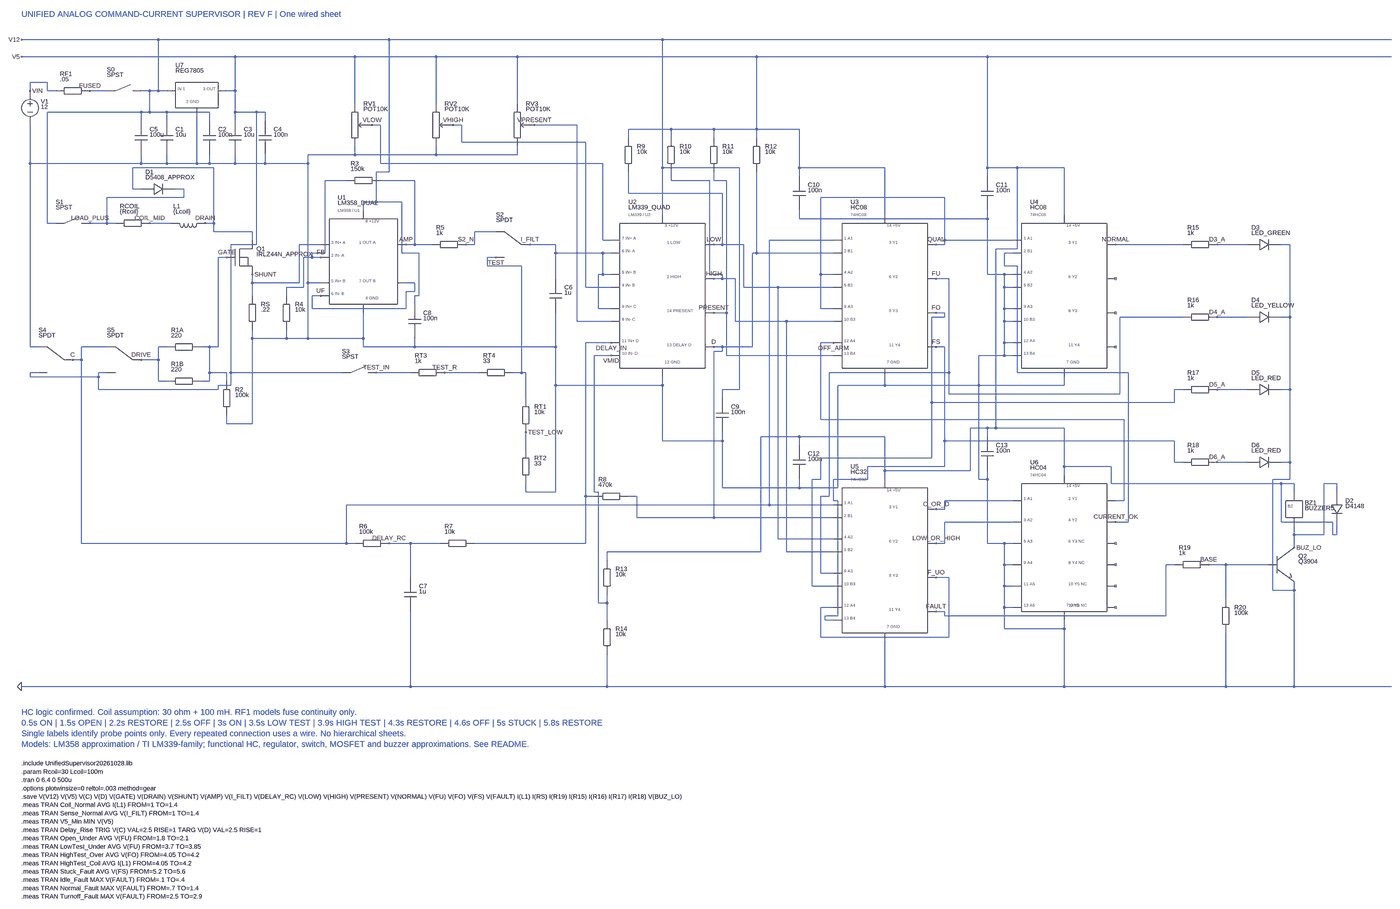
[diagram p0: schematic Unified_Supervisor.asc, whole sheet]
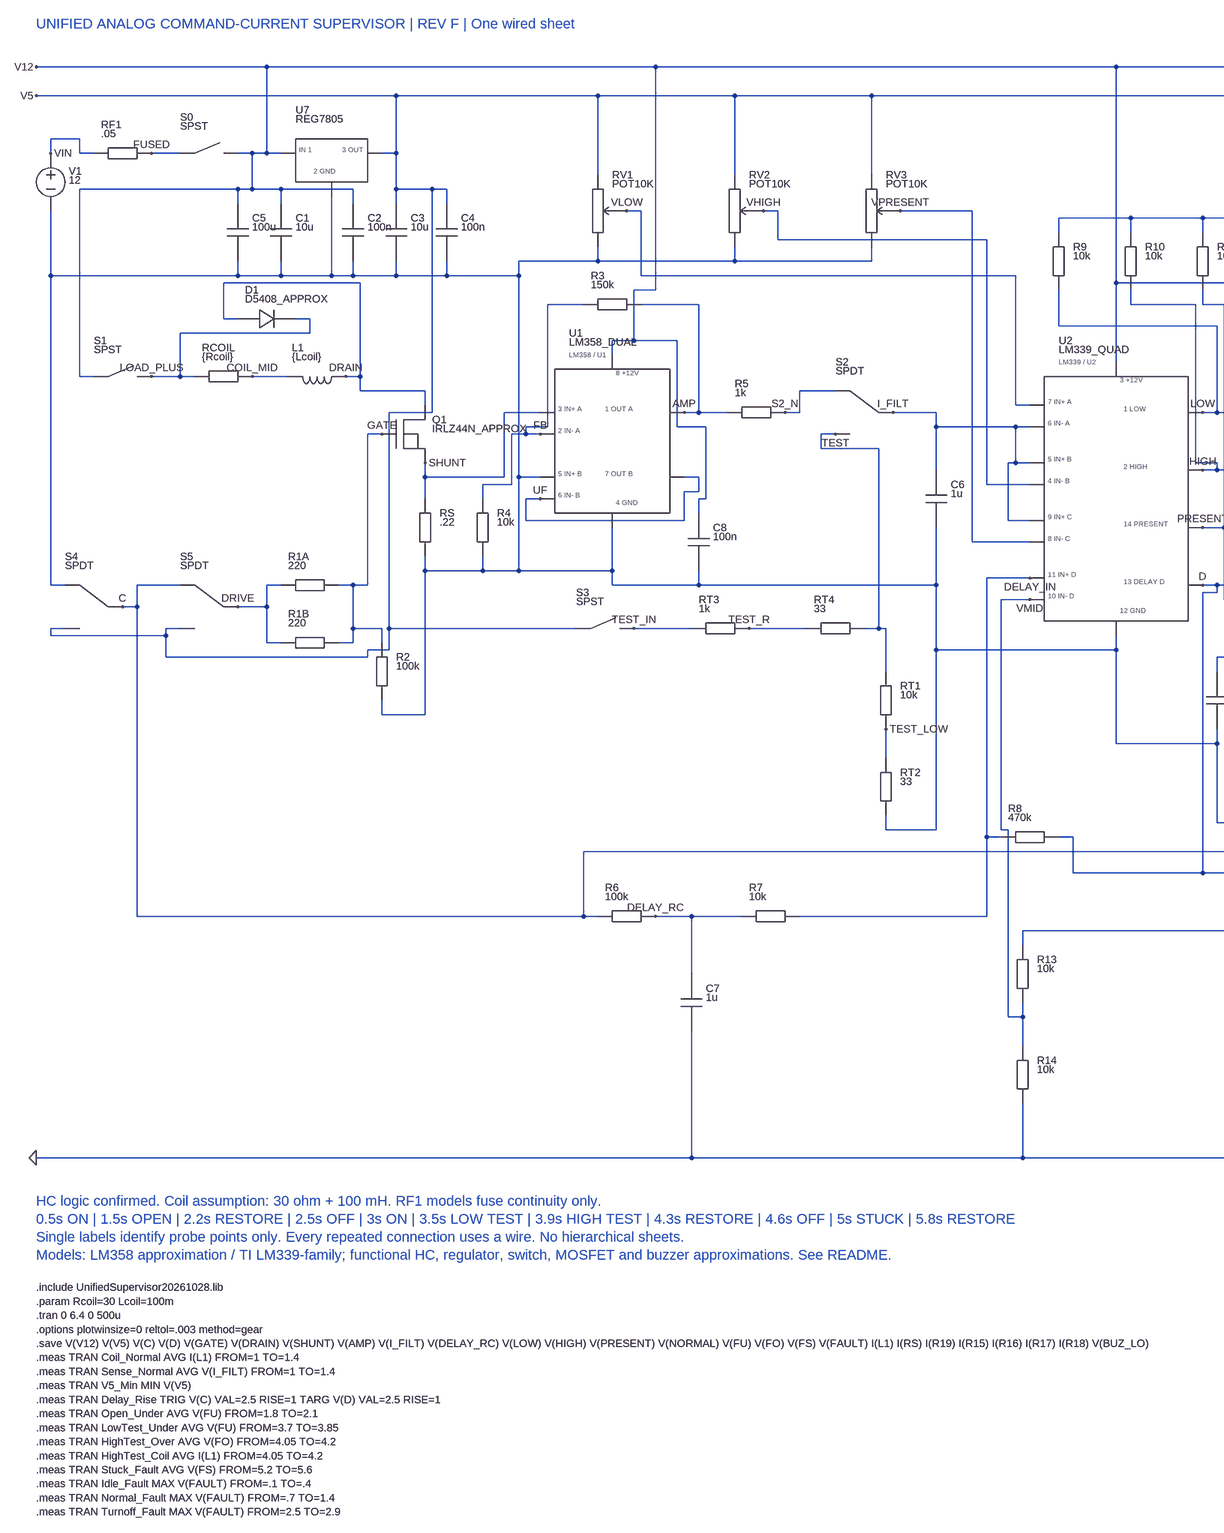
[diagram p1: schematic Unified_Supervisor.asc, part, row 1 of 1, column 1 of 2]
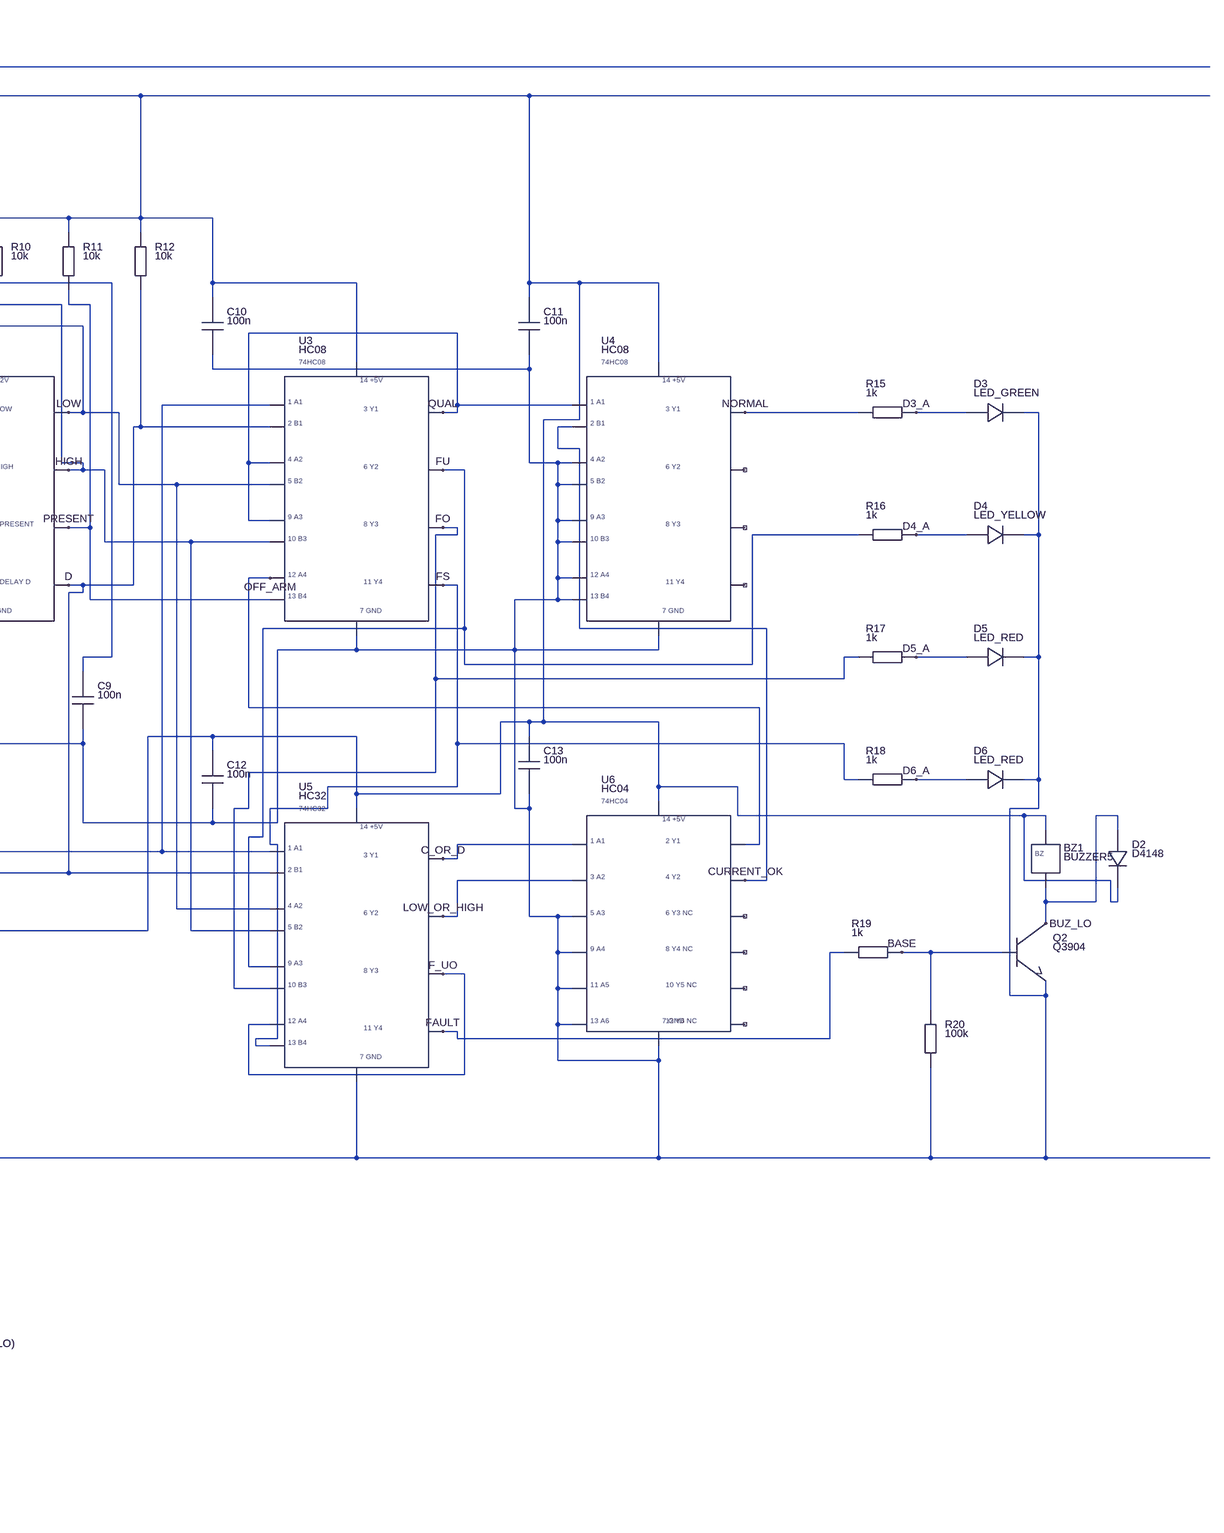
[diagram p2: schematic Unified_Supervisor.asc, part, row 1 of 1, column 2 of 2]
Unified_Supervisor.asc, the LTspice schematic file:
Version 4
SHEET 1 5280 2944
WIRE 32 96 544 96
WIRE 544 96 1408 96
WIRE 1408 96 2432 96
WIRE 2432 96 5168 96
WIRE 32 160 832 160
WIRE 832 160 1280 160
WIRE 1280 160 1584 160
WIRE 1584 160 1888 160
WIRE 1888 160 2784 160
WIRE 2784 160 3648 160
WIRE 3648 160 5168 160
WIRE 32 2624 1488 2624
WIRE 1488 2624 2224 2624
WIRE 2224 2624 3264 2624
WIRE 3264 2624 3936 2624
WIRE 3936 2624 4544 2624
WIRE 4544 2624 4800 2624
WIRE 4800 2624 5168 2624
WIRE 64 256 64 288
WIRE 64 416 64 448
WIRE 128 288 160 288
WIRE 288 288 320 288
WIRE 320 288 352 288
WIRE 480 288 512 288
WIRE 544 288 576 288
WIRE 688 384 688 416
WIRE 800 288 832 288
WIRE 480 368 480 400
WIRE 480 528 480 560
WIRE 576 368 576 400
WIRE 576 528 576 560
WIRE 736 368 736 400
WIRE 736 528 736 560
WIRE 832 368 832 400
WIRE 832 528 832 560
WIRE 944 368 944 400
WIRE 944 528 944 560
WIRE 128 784 160 784
WIRE 288 784 320 784
WIRE 352 784 384 784
WIRE 512 784 544 784
WIRE 560 784 592 784
WIRE 720 784 752 784
WIRE 448 656 480 656
WIRE 608 656 640 656
WIRE 896 816 896 848
WIRE 768 912 800 912
WIRE 896 976 896 1008
WIRE 896 1024 896 1056
WIRE 896 1184 896 1216
WIRE 64 1248 96 1248
WIRE 64 1344 96 1344
WIRE 224 1296 256 1296
WIRE 320 1248 352 1248
WIRE 320 1344 352 1344
WIRE 480 1296 512 1296
WIRE 544 1248 576 1248
WIRE 704 1248 736 1248
WIRE 544 1376 576 1376
WIRE 704 1376 736 1376
WIRE 800 1344 800 1376
WIRE 800 1504 800 1536
WIRE 1472 864 1504 864
WIRE 1120 912 1152 912
WIRE 1120 864 1152 864
WIRE 1312 1120 1312 1152
WIRE 1120 1008 1152 1008
WIRE 1120 1056 1152 1056
WIRE 1472 1008 1504 1008
WIRE 1312 704 1312 736
WIRE 1216 624 1248 624
WIRE 1376 624 1408 624
WIRE 1024 1024 1024 1056
WIRE 1024 1184 1024 1216
WIRE 1504 1056 1504 1088
WIRE 1504 1216 1504 1248
WIRE 1536 864 1568 864
WIRE 1696 864 1728 864
WIRE 1776 816 1808 816
WIRE 1776 912 1808 912
WIRE 1936 864 1968 864
WIRE 2032 960 2032 992
WIRE 2032 1120 2032 1152
WIRE 1200 1344 1232 1344
WIRE 1360 1344 1392 1344
WIRE 1456 1344 1488 1344
WIRE 1616 1344 1648 1344
WIRE 1712 1344 1744 1344
WIRE 1872 1344 1904 1344
WIRE 1920 1408 1920 1440
WIRE 1920 1568 1920 1600
WIRE 1920 1600 1920 1632
WIRE 1920 1760 1920 1792
WIRE 1280 304 1280 336
WIRE 1344 416 1376 416
WIRE 1280 496 1280 528
WIRE 1584 304 1584 336
WIRE 1648 416 1680 416
WIRE 1584 496 1584 528
WIRE 1888 304 1888 336
WIRE 1952 416 1984 416
WIRE 1888 496 1888 528
WIRE 2624 864 2656 864
WIRE 2624 992 2656 992
WIRE 2432 720 2432 752
WIRE 2208 1024 2240 1024
WIRE 2208 976 2240 976
WIRE 2208 896 2240 896
WIRE 2208 848 2240 848
WIRE 2208 1152 2240 1152
WIRE 2208 1104 2240 1104
WIRE 2208 1280 2240 1280
WIRE 2208 1232 2240 1232
WIRE 2432 1360 2432 1392
WIRE 2624 1248 2656 1248
WIRE 2624 1120 2656 1120
WIRE 2304 432 2304 464
WIRE 2304 592 2304 624
WIRE 2464 432 2464 464
WIRE 2464 592 2464 624
WIRE 2624 432 2624 464
WIRE 2624 592 2624 624
WIRE 2784 432 2784 464
WIRE 2784 592 2784 624
WIRE 2656 1408 2656 1440
WIRE 2656 1568 2656 1600
WIRE 1248 1984 1280 1984
WIRE 1408 1984 1440 1984
WIRE 1488 2080 1488 2112
WIRE 1488 2240 1488 2272
WIRE 1568 1984 1600 1984
WIRE 1728 1984 1760 1984
WIRE 2144 1808 2176 1808
WIRE 2304 1808 2336 1808
WIRE 2224 2016 2224 2048
WIRE 2224 2176 2224 2208
WIRE 2224 2240 2224 2272
WIRE 2224 2400 2224 2432
WIRE 3040 848 3072 848
WIRE 3040 896 3072 896
WIRE 3456 864 3488 864
WIRE 3040 976 3072 976
WIRE 3040 1024 3072 1024
WIRE 3456 992 3488 992
WIRE 3264 1360 3264 1392
WIRE 3456 1120 3488 1120
WIRE 3040 1104 3072 1104
WIRE 3040 1152 3072 1152
WIRE 3456 1248 3488 1248
WIRE 3040 1232 3072 1232
WIRE 3040 1280 3072 1280
WIRE 3264 720 3264 752
WIRE 3040 1840 3072 1840
WIRE 3040 1888 3072 1888
WIRE 3456 1856 3488 1856
WIRE 3040 1968 3072 1968
WIRE 3040 2016 3072 2016
WIRE 3456 1984 3488 1984
WIRE 3264 2352 3264 2384
WIRE 3456 2112 3488 2112
WIRE 3040 2096 3072 2096
WIRE 3040 2144 3072 2144
WIRE 3456 2240 3488 2240
WIRE 3040 2224 3072 2224
WIRE 3040 2272 3072 2272
WIRE 3264 1712 3264 1744
WIRE 3712 1824 3744 1824
WIRE 4128 1824 4160 1824
WIRE 3712 1904 3744 1904
WIRE 4128 1904 4160 1904
WIRE 3712 1984 3744 1984
WIRE 3936 2272 3936 2304
WIRE 3712 2064 3744 2064
WIRE 3712 2144 3744 2144
WIRE 3712 2224 3744 2224
WIRE 3936 1696 3936 1728
WIRE 3712 848 3744 848
WIRE 3712 896 3744 896
WIRE 4128 864 4160 864
WIRE 3712 976 3744 976
WIRE 3712 1024 3744 1024
WIRE 3936 1360 3936 1392
WIRE 3712 1104 3744 1104
WIRE 3712 1152 3744 1152
WIRE 3712 1232 3744 1232
WIRE 3712 1280 3744 1280
WIRE 3936 720 3936 752
WIRE 2944 576 2944 608
WIRE 2944 736 2944 768
WIRE 3648 576 3648 608
WIRE 3648 736 3648 768
WIRE 2944 1584 2944 1616
WIRE 2944 1744 2944 1776
WIRE 3648 1552 3648 1584
WIRE 3648 1712 3648 1744
WIRE 4352 864 4384 864
WIRE 4512 864 4544 864
WIRE 4592 864 4624 864
WIRE 4752 864 4784 864
WIRE 4352 1136 4384 1136
WIRE 4512 1136 4544 1136
WIRE 4592 1136 4624 1136
WIRE 4752 1136 4784 1136
WIRE 4352 1408 4384 1408
WIRE 4512 1408 4544 1408
WIRE 4592 1408 4624 1408
WIRE 4752 1408 4784 1408
WIRE 4352 1680 4384 1680
WIRE 4512 1680 4544 1680
WIRE 4592 1680 4624 1680
WIRE 4752 1680 4784 1680
WIRE 4320 2064 4352 2064
WIRE 4480 2064 4512 2064
WIRE 4544 2160 4544 2192
WIRE 4544 2320 4544 2352
WIRE 4800 1968 4800 2000
WIRE 4672 2064 4704 2064
WIRE 4800 2128 4800 2160
WIRE 4800 1760 4800 1792
WIRE 4800 1920 4800 1952
WIRE 4960 1760 4960 1792
WIRE 4960 1920 4960 1952
WIRE 2224 2432 2224 2624
WIRE 3264 2384 3264 2624
WIRE 4544 2352 4544 2624
WIRE 3936 2304 3936 2624
WIRE 3712 2224 3712 2304
WIRE 3712 2304 3936 2304
WIRE 3712 2144 3712 2224
WIRE 3712 2064 3712 2144
WIRE 3712 1984 3712 2064
WIRE 3648 1744 3648 1984
WIRE 3648 1984 3712 1984
WIRE 1488 2272 1488 2624
WIRE 4800 2160 4800 2624
WIRE 4784 1680 4784 1744
WIRE 4720 1744 4784 1744
WIRE 4720 1744 4720 2160
WIRE 4720 2160 4800 2160
WIRE 4784 1408 4784 1680
WIRE 4784 1136 4784 1408
WIRE 4784 864 4784 1136
WIRE 3616 1280 3712 1280
WIRE 3616 1280 3616 1392
WIRE 3616 1392 3616 1744
WIRE 3616 1744 3648 1744
WIRE 3712 1232 3712 1280
WIRE 3712 1152 3712 1232
WIRE 3712 1104 3712 1152
WIRE 3712 1024 3712 1104
WIRE 3712 976 3712 1024
WIRE 3648 768 3648 976
WIRE 3648 976 3712 976
WIRE 3616 1392 3936 1392
WIRE 3264 1392 3616 1392
WIRE 2944 768 3648 768
WIRE 2944 1776 3088 1776
WIRE 3088 1392 3088 1776
WIRE 3088 1392 3264 1392
WIRE 2656 1600 2656 1776
WIRE 2656 1776 2944 1776
WIRE 2432 1392 2432 1600
WIRE 2432 1600 2656 1600
WIRE 2032 1152 2032 1248
WIRE 2032 1248 2032 1392
WIRE 2032 1392 2432 1392
WIRE 1920 1792 2032 1792
WIRE 2032 1392 2032 1792
WIRE 1504 1248 2032 1248
WIRE 1312 1152 1312 1216
WIRE 1312 1216 1312 1248
WIRE 1312 1248 1504 1248
WIRE 1024 1216 1104 1216
WIRE 1104 1216 1312 1216
WIRE 896 1216 1024 1216
WIRE 1104 1008 1120 1008
WIRE 1104 1008 1104 1216
WIRE 800 1536 896 1536
WIRE 896 1216 896 1536
WIRE 944 560 1104 560
WIRE 1104 560 1104 1008
WIRE 832 560 944 560
WIRE 736 560 832 560
WIRE 576 560 688 560
WIRE 688 560 736 560
WIRE 480 560 576 560
WIRE 688 416 688 560
WIRE 1104 528 1280 528
WIRE 1104 528 1104 560
WIRE 1280 528 1584 528
WIRE 1584 528 1888 528
WIRE 64 448 64 560
WIRE 64 560 480 560
WIRE 64 560 64 1248
WIRE 544 784 560 784
WIRE 128 256 128 288
WIRE 64 256 128 256
WIRE 4544 864 4592 864
WIRE 4544 1136 4592 1136
WIRE 4544 1408 4592 1408
WIRE 4544 1680 4592 1680
WIRE 1392 1344 1456 1344
WIRE 1648 1344 1712 1344
WIRE 1728 816 1776 816
WIRE 1728 816 1728 864
WIRE 4160 864 4352 864
WIRE 3488 1824 3712 1824
WIRE 3488 1824 3488 1856
WIRE 1504 1008 1504 1040
WIRE 1472 1040 1504 1040
WIRE 1472 1040 1472 1104
WIRE 1120 1104 1472 1104
WIRE 1120 1056 1120 1104
WIRE 3488 1904 3712 1904
WIRE 3488 1904 3488 1984
WIRE 3488 2112 3504 2112
WIRE 3504 2112 3504 2336
WIRE 3024 2336 3504 2336
WIRE 3024 2224 3024 2336
WIRE 3024 2224 3040 2224
WIRE 2112 1152 2208 1152
WIRE 2112 416 2112 1152
WIRE 1984 416 2112 416
WIRE 4320 2064 4320 2256
WIRE 3488 2256 4320 2256
WIRE 3488 2240 3488 2256
WIRE 2144 1024 2208 1024
WIRE 2144 480 2144 1024
WIRE 1680 480 2144 480
WIRE 1680 416 1680 480
WIRE 2208 560 2208 848
WIRE 1376 560 2208 560
WIRE 1376 416 1376 560
WIRE 4160 1904 4176 1904
WIRE 4176 1344 4176 1904
WIRE 3760 1344 4176 1344
WIRE 3760 944 3760 1344
WIRE 3712 944 3760 944
WIRE 3712 896 3712 944
WIRE 4160 1520 4160 1824
WIRE 3024 1520 4160 1520
WIRE 3024 1232 3024 1520
WIRE 3024 1232 3040 1232
WIRE 544 1248 544 1296
WIRE 512 1296 544 1296
WIRE 544 1296 544 1376
WIRE 1440 1984 1488 1984
WIRE 1488 1984 1568 1984
WIRE 1488 1984 1488 2080
WIRE 4544 2064 4544 2160
WIRE 4512 2064 4544 2064
WIRE 4544 2064 4672 2064
WIRE 1504 624 1504 864
WIRE 1408 624 1504 624
WIRE 1504 864 1536 864
WIRE 896 1008 896 1024
WIRE 1072 864 1120 864
WIRE 1072 864 1072 1008
WIRE 896 1008 1072 1008
WIRE 4800 1952 4800 1968
WIRE 4912 1760 4960 1760
WIRE 4912 1760 4912 1952
WIRE 4800 1952 4912 1952
WIRE 320 784 352 784
WIRE 640 656 640 688
WIRE 352 688 640 688
WIRE 352 688 352 784
WIRE 752 576 752 784
WIRE 448 576 752 576
WIRE 448 576 448 656
WIRE 752 816 896 816
WIRE 752 784 752 816
WIRE 1088 912 1120 912
WIRE 1088 912 1088 1024
WIRE 1024 1024 1088 1024
WIRE 1168 624 1216 624
WIRE 1168 624 1168 896
WIRE 1120 896 1168 896
WIRE 1120 896 1120 912
WIRE 1904 944 1904 1344
WIRE 1776 944 1904 944
WIRE 1776 912 1776 944
WIRE 1920 1344 1920 1408
WIRE 1904 1344 1920 1344
WIRE 2656 1120 2672 1120
WIRE 2672 624 2672 1120
WIRE 2624 624 2672 624
WIRE 2672 1280 3040 1280
WIRE 2672 1120 2672 1280
WIRE 2144 1808 2144 1984
WIRE 1760 1984 2144 1984
WIRE 2144 1232 2208 1232
WIRE 2144 1232 2144 1808
WIRE 2192 2208 2224 2208
WIRE 2192 1792 2192 2208
WIRE 2176 1792 2192 1792
WIRE 2176 1280 2176 1792
WIRE 2176 1280 2208 1280
WIRE 2224 2208 2224 2240
WIRE 3488 992 3504 992
WIRE 3504 992 3504 1344
WIRE 3056 1344 3504 1344
WIRE 3056 1344 3056 1808
WIRE 3024 1808 3056 1808
WIRE 3024 1808 3024 2096
WIRE 3024 2096 3040 2096
WIRE 4144 1136 4352 1136
WIRE 4144 1136 4144 1424
WIRE 3504 1424 4144 1424
WIRE 3504 1344 3504 1424
WIRE 3488 1120 3488 1136
WIRE 3440 1136 3488 1136
WIRE 3440 1136 3440 1456
WIRE 3440 1456 3440 1664
WIRE 3024 1664 3440 1664
WIRE 3024 1664 3024 1744
WIRE 2992 1744 3024 1744
WIRE 2992 1744 2992 2144
WIRE 2992 2144 3040 2144
WIRE 4352 1408 4352 1456
WIRE 3440 1456 4352 1456
WIRE 3488 1248 3488 1600
WIRE 3488 1600 3488 1696
WIRE 3200 1696 3488 1696
WIRE 3200 1696 3200 1744
WIRE 3072 1744 3200 1744
WIRE 3072 1744 3072 1824
WIRE 3072 1824 3088 1824
WIRE 3088 1824 3088 2256
WIRE 3040 2256 3088 2256
WIRE 3040 2256 3040 2272
WIRE 4352 1600 4352 1680
WIRE 3488 1600 4352 1600
WIRE 3024 1104 3040 1104
WIRE 3024 976 3024 1104
WIRE 3024 976 3040 976
WIRE 3488 688 3488 848
WIRE 3488 848 3488 864
WIRE 3024 688 3488 688
WIRE 3024 688 3024 976
WIRE 3488 848 3712 848
WIRE 736 1248 736 1344
WIRE 736 1344 736 1376
WIRE 736 1344 800 1344
WIRE 768 912 768 1248
WIRE 736 1248 768 1248
WIRE 2656 976 2656 992
WIRE 2608 976 2656 976
WIRE 2608 624 2608 976
WIRE 2464 624 2608 624
WIRE 2704 1152 2896 1152
WIRE 2896 1152 3040 1152
WIRE 2704 992 2704 1152
WIRE 2656 992 2704 992
WIRE 2896 2016 3040 2016
WIRE 2896 1152 2896 2016
WIRE 2656 672 2656 864
WIRE 2304 672 2656 672
WIRE 2304 624 2304 672
WIRE 2736 1024 2864 1024
WIRE 2864 1024 3040 1024
WIRE 2736 864 2736 1024
WIRE 2656 864 2736 864
WIRE 2864 1968 3040 1968
WIRE 2864 1024 2864 1968
WIRE 2032 864 2032 896
WIRE 2032 896 2032 960
WIRE 1968 864 2032 864
WIRE 2032 896 2208 896
WIRE 2208 896 2208 976
WIRE 2192 1104 2208 1104
WIRE 2192 976 2192 1104
WIRE 2192 976 2208 976
WIRE 2336 1888 2624 1888
WIRE 2624 1888 3040 1888
WIRE 2336 1808 2336 1888
WIRE 2656 1248 2656 1264
WIRE 2624 1264 2656 1264
WIRE 2624 1264 2624 1888
WIRE 2768 896 2784 896
WIRE 2784 896 3040 896
WIRE 2768 896 2768 1248
WIRE 2656 1248 2768 1248
WIRE 2784 624 2784 896
WIRE 256 1248 320 1248
WIRE 256 1248 256 1296
WIRE 256 1984 1248 1984
WIRE 256 1296 256 1984
WIRE 1248 1840 2832 1840
WIRE 2832 1840 3040 1840
WIRE 1248 1840 1248 1984
WIRE 2832 848 3040 848
WIRE 2832 848 2832 1840
WIRE 544 96 544 288
WIRE 512 288 544 288
WIRE 480 368 512 368
WIRE 512 288 512 368
WIRE 512 368 576 368
WIRE 576 368 736 368
WIRE 1312 704 1360 704
WIRE 1360 592 1360 704
WIRE 1360 592 1408 592
WIRE 1408 96 1408 592
WIRE 1504 1056 1520 1056
WIRE 1520 896 1520 1056
WIRE 1456 896 1520 896
WIRE 1456 704 1456 896
WIRE 1360 704 1456 704
WIRE 2432 96 2432 576
WIRE 2432 576 2432 720
WIRE 128 368 128 784
WIRE 128 368 480 368
WIRE 2656 1408 2720 1408
WIRE 2720 576 2720 1408
WIRE 2432 576 2720 576
WIRE 832 160 832 288
WIRE 832 288 832 368
WIRE 832 368 912 368
WIRE 912 368 944 368
WIRE 1280 160 1280 304
WIRE 1584 160 1584 304
WIRE 1888 160 1888 304
WIRE 2784 160 2784 432
WIRE 2624 432 2784 432
WIRE 2464 432 2624 432
WIRE 2304 432 2464 432
WIRE 2944 432 2944 576
WIRE 2784 432 2944 432
WIRE 3648 160 3648 576
WIRE 3936 576 3936 720
WIRE 3648 576 3760 576
WIRE 3760 576 3936 576
WIRE 3264 576 3264 720
WIRE 2944 576 3264 576
WIRE 3648 1552 3680 1552
WIRE 3680 880 3680 1552
WIRE 3680 880 3760 880
WIRE 3760 576 3760 880
WIRE 3936 1552 3936 1696
WIRE 3680 1552 3936 1552
WIRE 3264 1712 3584 1712
WIRE 3584 1552 3584 1712
WIRE 3584 1552 3648 1552
WIRE 2944 1584 3264 1584
WIRE 3264 1584 3264 1712
WIRE 4112 1760 4752 1760
WIRE 4752 1760 4800 1760
WIRE 4112 1696 4112 1760
WIRE 3936 1696 4112 1696
WIRE 4944 1952 4960 1952
WIRE 4944 1904 4944 1952
WIRE 4752 1904 4944 1904
WIRE 4752 1760 4752 1904
WIRE 816 1344 1200 1344
WIRE 816 864 816 1344
WIRE 816 864 912 864
WIRE 912 368 912 864
WIRE 320 1344 320 1360
WIRE 320 1360 320 1408
WIRE 320 1408 768 1408
WIRE 768 1392 768 1408
WIRE 768 1392 816 1392
WIRE 816 1344 816 1392
WIRE 64 1344 64 1360
WIRE 64 1360 320 1360
WIRE 2224 2016 2800 2016
WIRE 2800 1584 2800 2016
WIRE 2800 1584 2944 1584
FLAG 32 2624 0
FLAG 288 288 FUSED
FLAG 1920 1568 TEST_LOW
FLAG 512 784 COIL_MID
FLAG 64 288 VIN
FLAG 4512 864 D3_A
FLAG 4512 1136 D4_A
FLAG 4512 1408 D5_A
FLAG 4512 1680 D6_A
FLAG 1360 1344 TEST_IN
FLAG 1616 1344 TEST_R
FLAG 1696 864 S2_N
FLAG 4128 864 NORMAL
FLAG 3456 1856 C_OR_D
FLAG 1152 1056 UF
FLAG 3456 1984 LOW_OR_HIGH
FLAG 3456 2112 F_UO
FLAG 1952 416 VPRESENT
FLAG 3456 2240 FAULT
FLAG 1648 416 VHIGH
FLAG 1344 416 VLOW
FLAG 4128 1904 CURRENT_OK
FLAG 3072 1232 OFF_ARM
FLAG 480 1296 DRIVE
FLAG 1408 1984 DELAY_RC
FLAG 4480 2064 BASE
FLAG 1472 864 AMP
FLAG 896 976 SHUNT
FLAG 4800 2000 BUZ_LO
FLAG 288 784 LOAD_PLUS
FLAG 720 784 DRAIN
FLAG 1152 912 FB
FLAG 1808 912 TEST
FLAG 2624 1120 PRESENT
FLAG 2240 1232 DELAY_IN
FLAG 2240 1280 VMID
FLAG 3456 992 FU
FLAG 3456 1120 FO
FLAG 3456 1248 FS
FLAG 3456 864 QUAL
FLAG 800 912 GATE
FLAG 2624 992 HIGH
FLAG 2624 864 LOW
FLAG 1936 864 I_FILT
FLAG 2624 1248 D
FLAG 224 1296 C
FLAG 32 96 V12
FLAG 32 160 V5
SYMBOL UnifiedSupervisor20261028\Supply 64 288 R0
SYMATTR InstName V1
SYMATTR Value 12
SYMBOL UnifiedSupervisor20261028\RH 160 288 R0
SYMATTR InstName RF1
SYMATTR Value .05
SYMBOL UnifiedSupervisor20261028\SPST 352 288 R0
SYMATTR InstName S0
SYMATTR Value SPST
SYMATTR SpiceLine MODE=0
SYMBOL UnifiedSupervisor20261028\Reg 576 256 R0
SYMATTR InstName U7
SYMATTR Value REG7805
SYMBOL UnifiedSupervisor20261028\CV 480 400 R0
SYMATTR InstName C5
SYMATTR Value 100u
SYMBOL UnifiedSupervisor20261028\CV 576 400 R0
SYMATTR InstName C1
SYMATTR Value 10u
SYMBOL UnifiedSupervisor20261028\CV 736 400 R0
SYMATTR InstName C2
SYMATTR Value 100n
SYMBOL UnifiedSupervisor20261028\CV 832 400 R0
SYMATTR InstName C3
SYMATTR Value 10u
SYMBOL UnifiedSupervisor20261028\CV 944 400 R0
SYMATTR InstName C4
SYMATTR Value 100n
SYMBOL UnifiedSupervisor20261028\SPST 160 784 R0
SYMATTR InstName S1
SYMATTR Value SPST
SYMATTR SpiceLine MODE=1
SYMBOL UnifiedSupervisor20261028\RH 384 784 R0
SYMATTR InstName RCOIL
SYMATTR Value {Rcoil}
SYMBOL UnifiedSupervisor20261028\Coil 592 784 R0
SYMATTR InstName L1
SYMATTR Value {Lcoil}
SYMBOL UnifiedSupervisor20261028\DH 480 656 R0
SYMATTR InstName D1
SYMATTR Value D5408_APPROX
SYMBOL UnifiedSupervisor20261028\MOS 800 848 R0
SYMATTR InstName Q1
SYMATTR Value IRLZ44N_APPROX
SYMBOL UnifiedSupervisor20261028\RV 896 1056 R0
SYMATTR InstName RS
SYMATTR Value .22
SYMBOL UnifiedSupervisor20261028\SPDT 96 1248 R0
SYMATTR InstName S4
SYMATTR Value SPDT
SYMATTR SpiceLine MODE=4
SYMBOL UnifiedSupervisor20261028\SPDT 352 1248 R0
SYMATTR InstName S5
SYMATTR Value SPDT
SYMATTR SpiceLine MODE=5
SYMBOL UnifiedSupervisor20261028\RH 576 1248 R0
SYMATTR InstName R1A
SYMATTR Value 220
SYMBOL UnifiedSupervisor20261028\RH 576 1376 R0
SYMATTR InstName R1B
SYMATTR Value 220
SYMBOL UnifiedSupervisor20261028\RV 800 1376 R0
SYMATTR InstName R2
SYMATTR Value 100k
SYMBOL UnifiedSupervisor20261028\LM358 1152 768 R0
SYMATTR InstName U1
SYMATTR Value LM358_DUAL
SYMBOL UnifiedSupervisor20261028\RH 1248 624 R0
SYMATTR InstName R3
SYMATTR Value 150k
SYMBOL UnifiedSupervisor20261028\RV 1024 1056 R0
SYMATTR InstName R4
SYMATTR Value 10k
SYMBOL UnifiedSupervisor20261028\CV 1504 1088 R0
SYMATTR InstName C8
SYMATTR Value 100n
SYMBOL UnifiedSupervisor20261028\RH 1568 864 R0
SYMATTR InstName R5
SYMATTR Value 1k
SYMBOL UnifiedSupervisor20261028\SPDT 1808 816 R0
SYMATTR InstName S2
SYMATTR Value SPDT
SYMATTR SpiceLine MODE=2
SYMBOL UnifiedSupervisor20261028\CV 2032 992 R0
SYMATTR InstName C6
SYMATTR Value 1u
SYMBOL UnifiedSupervisor20261028\SPST 1232 1344 R0
SYMATTR InstName S3
SYMATTR Value SPST
SYMATTR SpiceLine MODE=3
SYMBOL UnifiedSupervisor20261028\RH 1488 1344 R0
SYMATTR InstName RT3
SYMATTR Value 1k
SYMBOL UnifiedSupervisor20261028\RH 1744 1344 R0
SYMATTR InstName RT4
SYMATTR Value 33
SYMBOL UnifiedSupervisor20261028\RV 1920 1440 R0
SYMATTR InstName RT1
SYMATTR Value 10k
SYMBOL UnifiedSupervisor20261028\RV 1920 1632 R0
SYMATTR InstName RT2
SYMATTR Value 33
SYMBOL UnifiedSupervisor20261028\POT 1280 336 R0
SYMATTR InstName RV1
SYMATTR Value POT10K
SYMATTR SpiceLine K=0.17
SYMBOL UnifiedSupervisor20261028\POT 1584 336 R0
SYMATTR InstName RV2
SYMATTR Value POT10K
SYMATTR SpiceLine K=0.422
SYMBOL UnifiedSupervisor20261028\POT 1888 336 R0
SYMATTR InstName RV3
SYMATTR Value POT10K
SYMATTR SpiceLine K=0.042
SYMBOL UnifiedSupervisor20261028\LM339 2240 784 R0
SYMATTR InstName U2
SYMATTR Value LM339_QUAD
SYMBOL UnifiedSupervisor20261028\RV 2304 464 R0
SYMATTR InstName R9
SYMATTR Value 10k
SYMBOL UnifiedSupervisor20261028\RV 2464 464 R0
SYMATTR InstName R10
SYMATTR Value 10k
SYMBOL UnifiedSupervisor20261028\RV 2624 464 R0
SYMATTR InstName R11
SYMATTR Value 10k
SYMBOL UnifiedSupervisor20261028\RV 2784 464 R0
SYMATTR InstName R12
SYMATTR Value 10k
SYMBOL UnifiedSupervisor20261028\CV 2656 1440 R0
SYMATTR InstName C9
SYMATTR Value 100n
SYMBOL UnifiedSupervisor20261028\RH 1280 1984 R0
SYMATTR InstName R6
SYMATTR Value 100k
SYMBOL UnifiedSupervisor20261028\CV 1488 2112 R0
SYMATTR InstName C7
SYMATTR Value 1u
SYMBOL UnifiedSupervisor20261028\RH 1600 1984 R0
SYMATTR InstName R7
SYMATTR Value 10k
SYMBOL UnifiedSupervisor20261028\RH 2176 1808 R0
SYMATTR InstName R8
SYMATTR Value 470k
SYMBOL UnifiedSupervisor20261028\RV 2224 2048 R0
SYMATTR InstName R13
SYMATTR Value 10k
SYMBOL UnifiedSupervisor20261028\RV 2224 2272 R0
SYMATTR InstName R14
SYMATTR Value 10k
SYMBOL UnifiedSupervisor20261028\HC08 3072 784 R0
SYMATTR InstName U3
SYMATTR Value HC08
SYMBOL UnifiedSupervisor20261028\HC32 3072 1776 R0
SYMATTR InstName U5
SYMATTR Value HC32
SYMBOL UnifiedSupervisor20261028\HC04 3744 1760 R0
SYMATTR InstName U6
SYMATTR Value HC04
SYMBOL UnifiedSupervisor20261028\HC08 3744 784 R0
SYMATTR InstName U4
SYMATTR Value HC08
SYMBOL UnifiedSupervisor20261028\CV 2944 608 R0
SYMATTR InstName C10
SYMATTR Value 100n
SYMBOL UnifiedSupervisor20261028\CV 3648 608 R0
SYMATTR InstName C11
SYMATTR Value 100n
SYMBOL UnifiedSupervisor20261028\CV 2944 1616 R0
SYMATTR InstName C12
SYMATTR Value 100n
SYMBOL UnifiedSupervisor20261028\CV 3648 1584 R0
SYMATTR InstName C13
SYMATTR Value 100n
SYMBOL UnifiedSupervisor20261028\RH 4384 864 R0
SYMATTR InstName R15
SYMATTR Value 1k
SYMBOL UnifiedSupervisor20261028\DH 4624 864 R0
SYMATTR InstName D3
SYMATTR Value LED_GREEN
SYMBOL UnifiedSupervisor20261028\RH 4384 1136 R0
SYMATTR InstName R16
SYMATTR Value 1k
SYMBOL UnifiedSupervisor20261028\DH 4624 1136 R0
SYMATTR InstName D4
SYMATTR Value LED_YELLOW
SYMBOL UnifiedSupervisor20261028\RH 4384 1408 R0
SYMATTR InstName R17
SYMATTR Value 1k
SYMBOL UnifiedSupervisor20261028\DH 4624 1408 R0
SYMATTR InstName D5
SYMATTR Value LED_RED
SYMBOL UnifiedSupervisor20261028\RH 4384 1680 R0
SYMATTR InstName R18
SYMATTR Value 1k
SYMBOL UnifiedSupervisor20261028\DH 4624 1680 R0
SYMATTR InstName D6
SYMATTR Value LED_RED
SYMBOL UnifiedSupervisor20261028\RH 4352 2064 R0
SYMATTR InstName R19
SYMATTR Value 1k
SYMBOL UnifiedSupervisor20261028\RV 4544 2192 R0
SYMATTR InstName R20
SYMATTR Value 100k
SYMBOL UnifiedSupervisor20261028\USNPN 4704 2000 R0
SYMATTR InstName Q2
SYMATTR Value Q3904
SYMBOL UnifiedSupervisor20261028\Buzzer 4800 1792 R0
SYMATTR InstName BZ1
SYMATTR Value BUZZER5
SYMBOL UnifiedSupervisor20261028\DV 4960 1792 R0
SYMATTR InstName D2
SYMATTR Value D4148
TEXT 32 0 Left 3 ;UNIFIED ANALOG COMMAND-CURRENT SUPERVISOR | REV F | One wired sheet
TEXT 32 2720 Left 3 ;HC logic confirmed. Coil assumption: 30 ohm + 100 mH. RF1 models fuse continuity only.
TEXT 32 2760 Left 3 ;0.5s ON | 1.5s OPEN | 2.2s RESTORE | 2.5s OFF | 3s ON | 3.5s LOW TEST | 3.9s HIGH TEST | 4.3s RESTORE | 4.6s OFF | 5s STUCK | 5.8s RESTORE
TEXT 32 2800 Left 3 ;Single labels identify probe points only. Every repeated connection uses a wire. No hierarchical sheets.
TEXT 32 2840 Left 3 ;Models: LM358 approximation / TI LM339-family; functional HC, regulator, switch, MOSFET and buzzer approximations. See README.
TEXT 32 2912 Left 2 !.include UnifiedSupervisor20261028.lib\n.param Rcoil=30 Lcoil=100m\n.tran 0 6.4 0 500u\n.options plotwinsize=0 reltol=.003 method=gear\n.save V(V12) V(V5) V(C) V(D) V(GATE) V(DRAIN) V(SHUNT) V(AMP) V(I_FILT) V(DELAY_RC) V(LOW) V(HIGH) V(PRESENT) V(NORMAL) V(FU) V(FO) V(FS) V(FAULT) I(L1) I(RS) I(R19) I(R15) I(R16) I(R17) I(R18) V(BUZ_LO)\n.meas TRAN Coil_Normal AVG I(L1) FROM=1 TO=1.4\n.meas TRAN Sense_Normal AVG V(I_FILT) FROM=1 TO=1.4\n.meas TRAN V5_Min MIN V(V5)\n.meas TRAN Delay_Rise TRIG V(C) VAL=2.5 RISE=1 TARG V(D) VAL=2.5 RISE=1\n.meas TRAN Open_Under AVG V(FU) FROM=1.8 TO=2.1\n.meas TRAN LowTest_Under AVG V(FU) FROM=3.7 TO=3.85\n.meas TRAN HighTest_Over AVG V(FO) FROM=4.05 TO=4.2\n.meas TRAN HighTest_Coil AVG I(L1) FROM=4.05 TO=4.2\n.meas TRAN Stuck_Fault AVG V(FS) FROM=5.2 TO=5.6\n.meas TRAN Idle_Fault MAX V(FAULT) FROM=.1 TO=.4\n.meas TRAN Normal_Fault MAX V(FAULT) FROM=.7 TO=1.4\n.meas TRAN Turnoff_Fault MAX V(FAULT) FROM=2.5 TO=2.9

The netlist it stands for:
* Unified_Supervisor.asc
V1 VIN 0 12
RF1 VIN FUSED .05
XS0 FUSED V12 SPST MODE=0  ; pins A B
XU7 V12 0 V5 REG7805  ; pins IN GND OUT
C5 V12 0 100u
C1 V12 0 10u
C2 V12 0 100n
C3 V5 0 10u
C4 V5 0 100n
XS1 V12 LOAD_PLUS SPST MODE=1  ; pins A B
RCOIL LOAD_PLUS COIL_MID {Rcoil}
L1 COIL_MID DRAIN {Lcoil}
D1 DRAIN LOAD_PLUS D5408_APPROX
M§Q1 DRAIN GATE SHUNT SHUNT IRLZ44N_APPROX
RS SHUNT 0 .22
XS4 0 V5 C SPDT MODE=4  ; pins A B COM
XS5 C V5 DRIVE SPDT MODE=5  ; pins A B COM
R1A DRIVE GATE 220
R1B DRIVE GATE 220
R2 GATE 0 100k
XU1 AMP FB SHUNT 0 0 UF UF V12 LM358_DUAL  ; pins 1_OUT_A 2_IN-_A 3_IN+_A 4_GND 5_IN+_B 6_IN-_B 7_OUT_B 8_+12V
R3 FB AMP 150k
R4 FB 0 10k
C8 V12 0 100n
R5 AMP S2_N 1k
XS2 S2_N TEST I_FILT SPDT MODE=2  ; pins A B COM
C6 I_FILT 0 1u
XS3 V5 TEST_IN SPST MODE=3  ; pins A B
RT3 TEST_IN TEST_R 1k
RT4 TEST_R TEST 33
RT1 TEST TEST_LOW 10k
RT2 TEST_LOW 0 33
XRV1 V5 VLOW 0 POT10K K=0.17  ; pins 1 2_W 3
XRV2 V5 VHIGH 0 POT10K K=0.422  ; pins 1 2_W 3
XRV3 V5 VPRESENT 0 POT10K K=0.042  ; pins 1 2_W 3
XU2 LOW HIGH V12 VHIGH I_FILT I_FILT VLOW VPRESENT I_FILT VMID DELAY_IN 0 D PRESENT LM339_QUAD  ; pins 1_LOW 2_HIGH 3_+12V 4_IN-_B 5_IN+_B 6_IN-_A 7_IN+_A 8_IN-_C 9_IN+_C 10_IN-_D 11_IN+_D 12_GND 13_DELAY_D 14_PRESENT
R9 V5 LOW 10k
R10 V5 HIGH 10k
R11 V5 PRESENT 10k
R12 V5 D 10k
C9 V12 0 100n
R6 C DELAY_RC 100k
C7 DELAY_RC 0 1u
R7 DELAY_RC DELAY_IN 10k
R8 DELAY_IN D 470k
R13 V5 VMID 10k
R14 VMID 0 10k
XU3 C D QUAL QUAL LOW FU 0 FO QUAL HIGH FS OFF_ARM PRESENT V5 HC08  ; pins 1_A1 2_B1 3_Y1 4_A2 5_B2 6_Y2 7_GND 8_Y3 9_A3 10_B3 11_Y4 12_A4 13_B4 14_+5V
XU5 C D C_OR_D LOW HIGH LOW_OR_HIGH 0 F_UO FU FO FAULT F_UO FS V5 HC32  ; pins 1_A1 2_B1 3_Y1 4_A2 5_B2 6_Y2 7_GND 8_Y3 9_A3 10_B3 11_Y4 12_A4 13_B4 14_+5V
XU6 C_OR_D OFF_ARM LOW_OR_HIGH CURRENT_OK 0 NC_01 0 NC_02 0 NC_03 0 NC_04 0 V5 HC04  ; pins 1_A1 2_Y1 3_A2 4_Y2 5_A3 6_Y3_NC 7_GND 8_Y4_NC 9_A4 10_Y5_NC 11_A5 12_Y6_NC 13_A6 14_+5V
XU4 QUAL CURRENT_OK NORMAL 0 0 NC_05 0 NC_06 0 0 NC_07 0 0 V5 HC08  ; pins 1_A1 2_B1 3_Y1 4_A2 5_B2 6_Y2 7_GND 8_Y3 9_A3 10_B3 11_Y4 12_A4 13_B4 14_+5V
C10 V5 0 100n
C11 V5 0 100n
C12 V5 0 100n
C13 V5 0 100n
R15 NORMAL D3_A 1k
D3 D3_A 0 LED_GREEN
R16 FU D4_A 1k
D4 D4_A 0 LED_YELLOW
R17 FO D5_A 1k
D5 D5_A 0 LED_RED
R18 FS D6_A 1k
D6 D6_A 0 LED_RED
R19 FAULT BASE 1k
R20 BASE 0 100k
Q2 BUZ_LO BASE 0 0 Q3904
XBZ1 V5 BUZ_LO BUZZER5  ; pins + -
D2 BUZ_LO V5 D4148
.model D D
.lib standard.dio
.model NPN NPN
.model PNP PNP
.lib standard.bjt
.model NMOS NMOS
.model PMOS PMOS
.lib standard.mos
* UNIFIED ANALOG COMMAND-CURRENT SUPERVISOR | REV F | One wired sheet
* HC logic confirmed. Coil assumption: 30 ohm + 100 mH. RF1 models fuse continuity only.
* 0.5s ON | 1.5s OPEN | 2.2s RESTORE | 2.5s OFF | 3s ON | 3.5s LOW TEST | 3.9s HIGH TEST | 4.3s RESTORE | 4.6s OFF | 5s STUCK | 5.8s RESTORE
* Single labels identify probe points only. Every repeated connection uses a wire. No hierarchical sheets.
* Models: LM358 approximation / TI LM339-family; functional HC, regulator, switch, MOSFET and buzzer approximations. See README.
.include UnifiedSupervisor20261028.lib
.param Rcoil=30 Lcoil=100m
.tran 0 6.4 0 500u
.options plotwinsize=0 reltol=.003 method=gear
.save V(V12) V(V5) V(C) V(D) V(GATE) V(DRAIN) V(SHUNT) V(AMP) V(I_FILT) V(DELAY_RC) V(LOW) V(HIGH) V(PRESENT) V(NORMAL) V(FU) V(FO) V(FS) V(FAULT) I(L1) I(RS) I(R19) I(R15) I(R16) I(R17) I(R18) V(BUZ_LO)
.meas TRAN Coil_Normal AVG I(L1) FROM=1 TO=1.4
.meas TRAN Sense_Normal AVG V(I_FILT) FROM=1 TO=1.4
.meas TRAN V5_Min MIN V(V5)
.meas TRAN Delay_Rise TRIG V(C) VAL=2.5 RISE=1 TARG V(D) VAL=2.5 RISE=1
.meas TRAN Open_Under AVG V(FU) FROM=1.8 TO=2.1
.meas TRAN LowTest_Under AVG V(FU) FROM=3.7 TO=3.85
.meas TRAN HighTest_Over AVG V(FO) FROM=4.05 TO=4.2
.meas TRAN HighTest_Coil AVG I(L1) FROM=4.05 TO=4.2
.meas TRAN Stuck_Fault AVG V(FS) FROM=5.2 TO=5.6
.meas TRAN Idle_Fault MAX V(FAULT) FROM=.1 TO=.4
.meas TRAN Normal_Fault MAX V(FAULT) FROM=.7 TO=1.4
.meas TRAN Turnoff_Fault MAX V(FAULT) FROM=2.5 TO=2.9
.backanno
.end